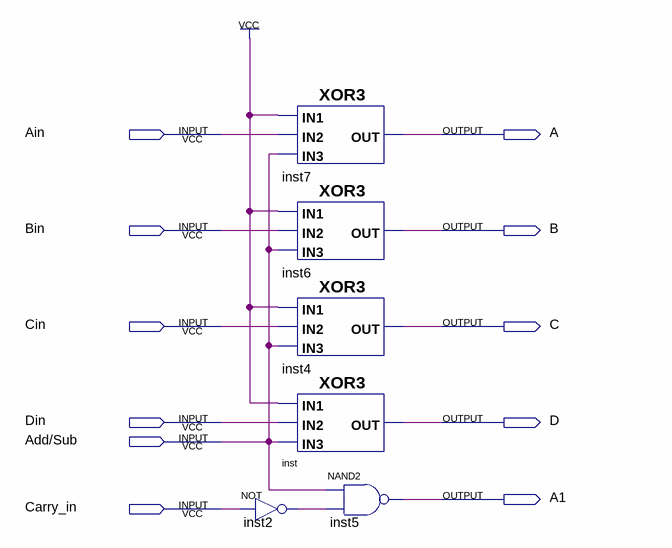
[diagram p0: schematic sheet]
// Quartus schematic Block2.bdf as structural Verilog: 6 symbols, 11 pins
module Block2 (
  input  Ain,
  input  Bin,
  input  Cin,
  input  Din,
  input  \Add/Sub ,
  input  Carry_in,
  output A,
  output B,
  output C,
  output D,
  output A1
);

  wire inst2_out;

  not inst2 (inst2_out, Carry_in);
  XOR3 inst7 (.IN3(\Add/Sub ), .IN1(1'b1), .IN2(Ain), .OUT(A));
  XOR3 inst6 (.IN3(\Add/Sub ), .IN1(1'b1), .IN2(Bin), .OUT(B));
  XOR3 inst4 (.IN3(\Add/Sub ), .IN1(1'b1), .IN2(Cin), .OUT(C));
  XOR3 inst (.IN3(\Add/Sub ), .IN1(1'b1), .IN2(Din), .OUT(D));
  nand inst5 (A1, \Add/Sub , inst2_out);
endmodule
